# Altium schematic sheet Serial_Interface_I2C.SchDoc
size A; DocumentNumber: 10; SheetNumber: 10; SheetTotal: 14
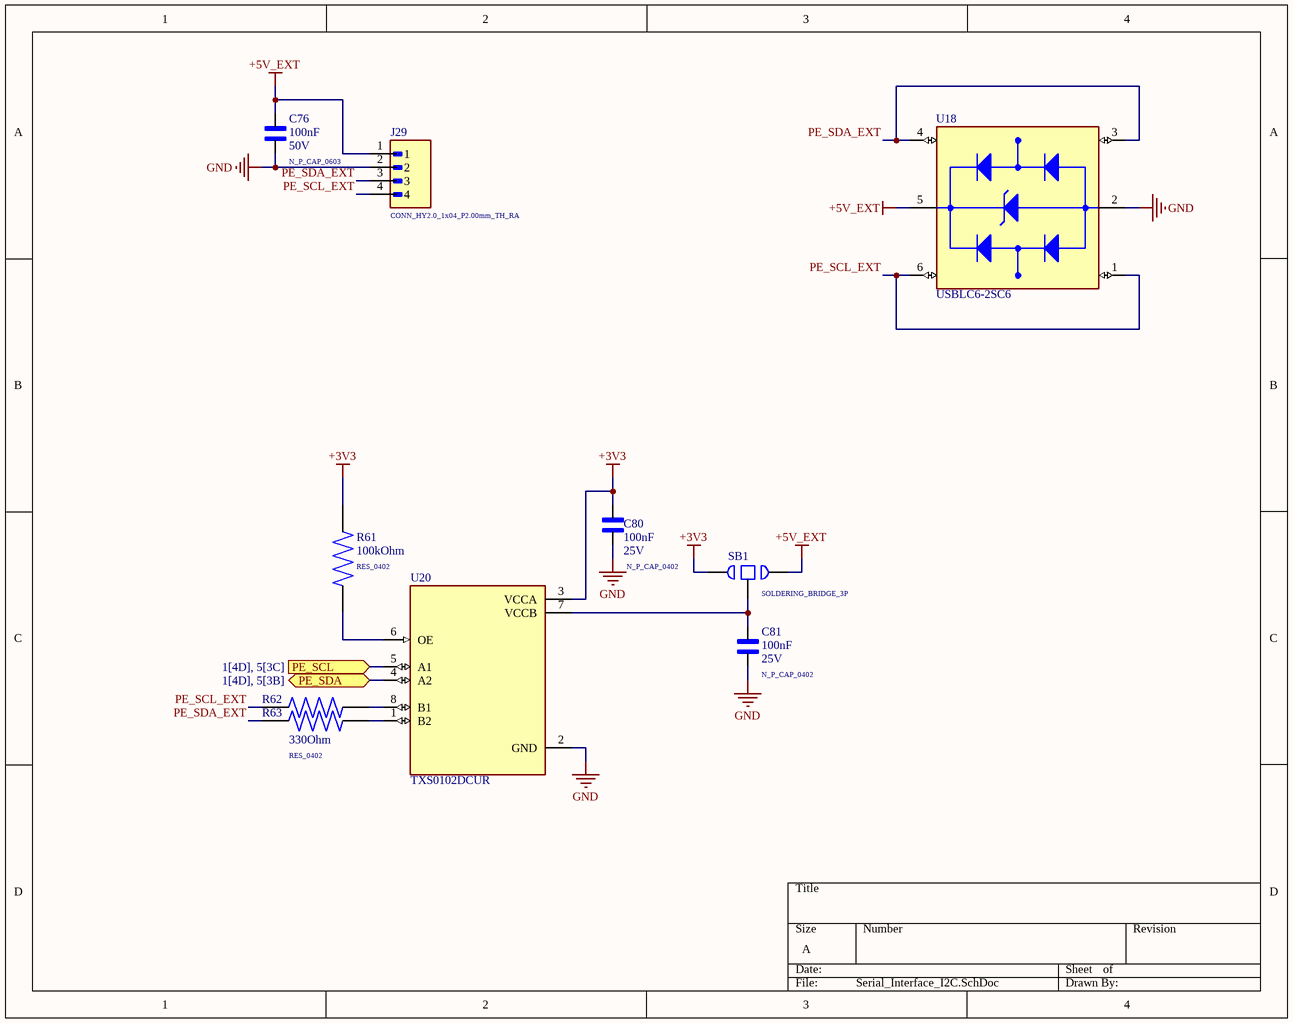
[diagram p0: Serial_Interface_I2C.SchDoc]

## Parts
C76  N_P_CAP_0603  value 100nF  Rated Voltage: 50V  [N_P_CAP_0603]
C80  N_P_CAP_0402  value 100nF  Rated Voltage: 25V  [N_P_CAP_0402]
C81  N_P_CAP_0402  value 100nF  Rated Voltage: 25V  [N_P_CAP_0402]
J29  CONN_HY2.0_1x04_P2.00mm_TH_RA  [CONN_HY2.0_1x04_P2.00mm_TH_RA]
R61  RES_0402  value 100kOhm  [RES_0402]
R62  RES_0402  [RES_0402]  (value not drawn)
R63  RES_0402  value 330Ohm  [RES_0402]
SB1  SOLDERING_BRIDGE_3P  [SOLDERING_BRIDGE_3P]  (no BOM)
U18  USBLC6-2SC6  [SOT95P280X145-6N]
U20  TXS0102DCUR  [SOP50P310X90-8N]

## Ports
PE_SCL (in, see 1[4D], 5[3C]), PE_SDA (bidir, see 1[4D], 5[3B])

## Nets
+3V3: C80.2 R61.1 SB1.1 U20.3(VCCA)
+5V_EXT: C76.2 J29.1 SB1.2 U18.5(VBUS)
GND: C76.1 C80.1 C81.1 J29.2 U18.2(GND) U20.2(GND)
PE_SCL: U20.5(A1) ; port PE_SCL
PE_SCL_EXT: J29.4 R62.2 U18.1(I/O1_IN) U18.6(I/O1_OUT)
PE_SDA: U20.4(A2) ; port PE_SDA
PE_SDA_EXT: J29.3 R63.1 U18.3(I/O2_IN) U18.4(I/O2_OUT)
NetC81_2: C81.2 SB1.3 U20.7(VCCB)
NetR61_2: R61.2 U20.6(OE)
NetR62_1: R62.1 U20.8(B1)
NetR63_2: R63.2 U20.1(B2)

## Library data of the parts
C76 = N_P_CAP: GENERIC NON-POLARIZED CAP; LCSC Part Number: C106221; Tolerance: *; MF: *; ESR: *; MPN: *; Temperature Coefficient: *
C80 C81 = N_P_CAP: GENERIC NON-POLARIZED CAP; Temperature Coefficient: X7R; LCSC Part Number: C105883; Tolerance: *; MF: *; ESR: *; MPN: *
J29 = CONN_4P: GENERIC CONNECTOR 4P; MF: *; MPN: *; LCSC Part Number: C55381784
R61 = RES: GENERIC RES; Tolerance: 1%; Power Rating: *; MPN: *; Rated Voltage: *; Temperature Coefficient: *; LCSC Part Number: C60491
R62 = RES: GENERIC RES; MPN: RC0402FR-07330RL; Tolerance: 1%; Value: 330Ohm; Power Rating: *; Rated Voltage: *; Temperature Coefficient: *; LCSC Part Number: C105875
R63 = RES: GENERIC RES; MPN: RC0402FR-07330RL; Tolerance: 1%; Power Rating: *; Rated Voltage: *; Temperature Coefficient: *; LCSC Part Number: C105875
SB1 = SOLDERING_BRIDGE_3P: GENERIC SOLDERING BRIDGE 3P
U18 = USBLC6-2SC6: 17V Clamp 5A (8/20Âµs) Ipp Tvs Diode Surface Mount SOT-23-6; MF: STMicroelectronics; Package: SOT-23-6 STMicroelectronics; MPN: USBLC6-2SC6; LCSC Part Number: C7519
U20 = TXS0102DCUR: 2-Bit Bidirectional Voltage-Level Shifter for Open-Drain and Push-Pull Application; MF: Texas Instruments; Package: VSSOP-8 Texas Instruments; MPN: TXS0102DCUR